# Altium schematic sheet analog_power.SchDoc: Analog power supply and filtration
size A4; DocumentNumber: ADC-SCH-04; SheetNumber: 4; SheetTotal: 20
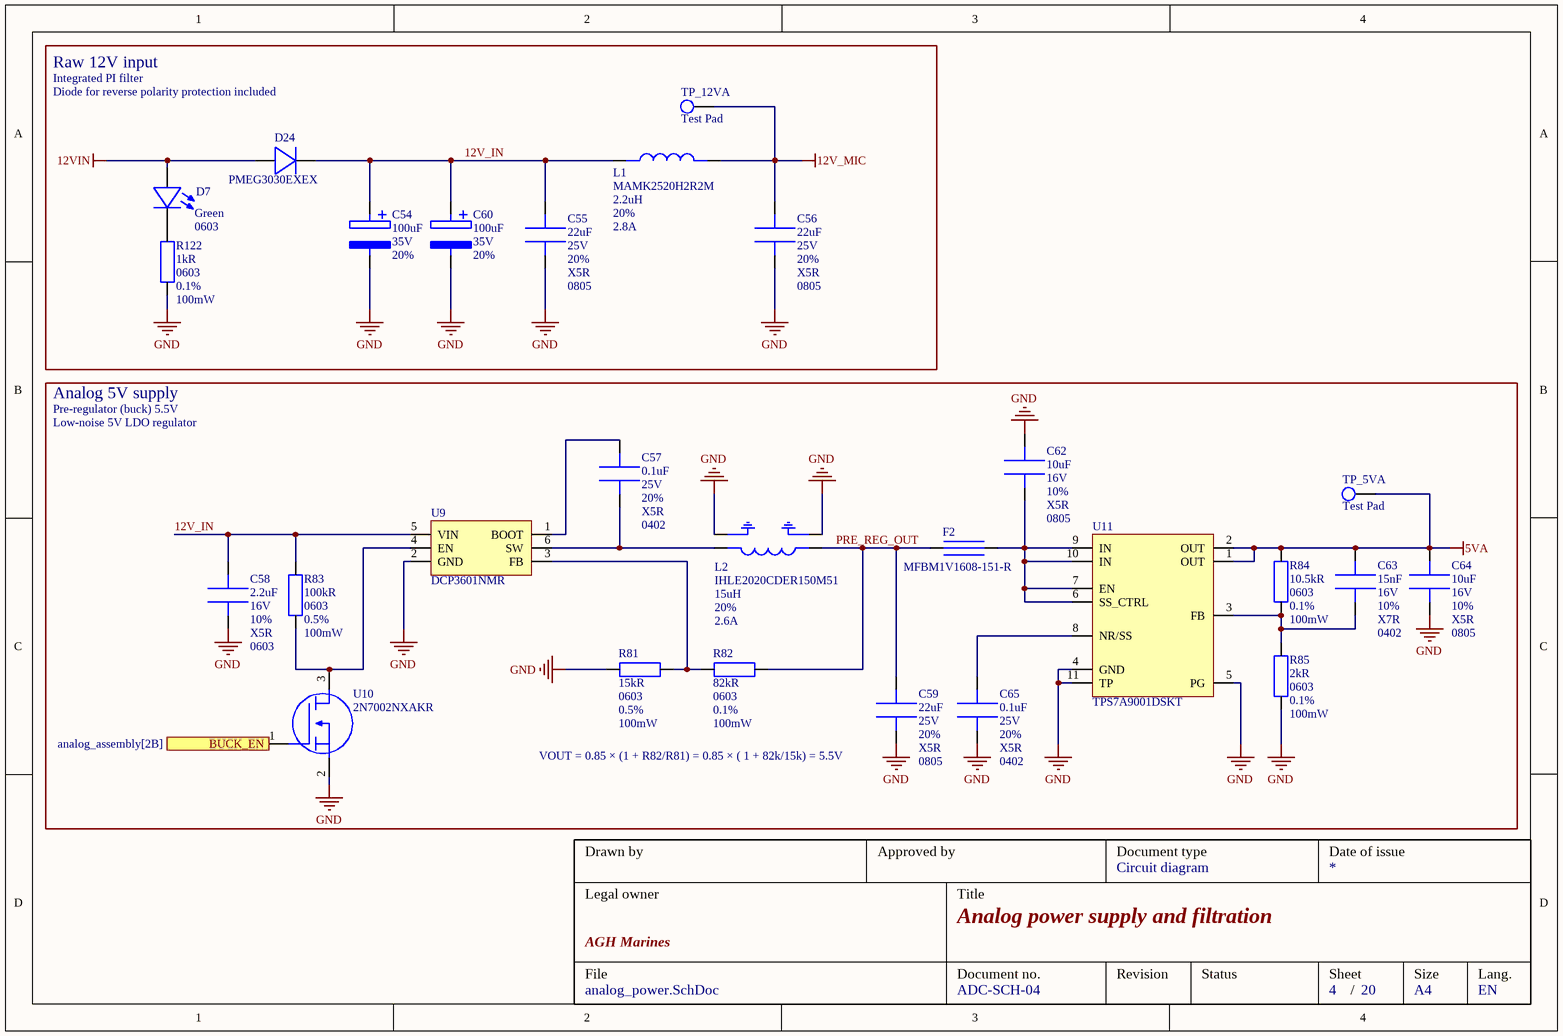
[diagram p0: analog_power.SchDoc]

## Parts
C54  value 100uF  Voltage: 35V  Tolerance: 20%  [CAPE_6.3R_7.7H]  (hidden comment: EDK107M035S9HAA)
C55  value 22uF  Voltage: 25V  Tolerance: 20%  Dielectric: X5R  Package: 0805  [CAPC_0805]  (hidden comment: CL21A226MAYNNNE)
C56  value 22uF  Voltage: 25V  Tolerance: 20%  Dielectric: X5R  Package: 0805  [CAPC_0805]  (hidden comment: CL21A226MAYNNNE)
C57  value 0.1uF  Voltage: 25V  Tolerance: 20%  Dielectric: X5R  Package: 0402  [CAPC_0402]  (hidden comment: MSAST105SB5104MFNA01)
C58  value 2.2uF  Voltage: 16V  Tolerance: 10%  Dielectric: X5R  Package: 0603  [CAPC_0603]  (hidden comment: C0603C225K4PAC)
C59  value 22uF  Voltage: 25V  Tolerance: 20%  Dielectric: X5R  Package: 0805  [CAPC_0805]  (hidden comment: CL21A226MAYNNNE)
C60  value 100uF  Voltage: 35V  Tolerance: 20%  [CAPE_6.3R_7.7H]  (hidden comment: EDK107M035S9HAA)
C62  value 10uF  Voltage: 16V  Tolerance: 10%  Dielectric: X5R  Package: 0805  [CAPC_0805]  (hidden comment: EMK212BJ106KG-T)
C63  value 15nF  Voltage: 16V  Tolerance: 10%  Dielectric: X7R  Package: 0402  [CAPC_0402]  (hidden comment: C0402C153K4RAC)
C64  value 10uF  Voltage: 16V  Tolerance: 10%  Dielectric: X5R  Package: 0805  [CAPC_0805]  (hidden comment: EMK212BJ106KG-T)
C65  value 0.1uF  Voltage: 25V  Tolerance: 20%  Dielectric: X5R  Package: 0402  [CAPC_0402]  (hidden comment: MSAST105SB5104MFNA01)
D7  package: 0603  color: Green  [DIOC_0603_LED]  (hidden comment: KG EELP41.22-PHRH-35-A8J8-20-R18)
D24  PMEG3030EXEX  [DIOC_SOD123HP-2]
F2  MFBM1V1608-151-R  [FERC_0603]
L1  MAMK2520H2R2M  Inductance: 2.2uH  Tolerance: 20%  Saturation Current: 2.8A  [IND_1008]
L2  IHLE2020CDER150M51  Saturation Current: 2.6A  Tolerance: 20%  Inductance: 15uH  [IND_2020_S]
R81  value 15kR  Package: 0603  Tolerance: 0.5%  Power: 100mW  [RESC_0603]  (hidden comment: RT0603DRD0715KL)
R82  value 82kR  Package: 0603  Tolerance: 0.1%  Power: 100mW  [RESC_0603]  (hidden comment: RT0603BRD0782KL)
R83  value 100kR  Package: 0603  Tolerance: 0.5%  Power: 100mW  [RESC_0603]  (hidden comment: AC0603DR-07100KL)
R84  value 10.5kR  Package: 0603  Tolerance: 0.1%  Power: 100mW  [RESC_0603]  (hidden comment: RT0603BRD0710K5L)
R85  value 2kR  Package: 0603  Tolerance: 0.1%  Power: 100mW  [RESC_0603]  (hidden comment: RT0603BRD072KL)
R122  value 1kR  Package: 0603  Tolerance: 0.1%  Power: 100mW  [RESC_0603]  (hidden comment: RP0603BRD071KL)
TP_5VA  Test Pad  [TP_1.4mm]
TP_12VA  Test Pad  [TP_1.4mm]
U9  DCP3601NMR  [IC_SOT23-6]
U10  2N7002NXAKR  [IC_SOT-23-3]
U11  TPS7A9001DSKT  [IC_SON-10]

## Blocks framed on the sheet
Raw 12V input: C54-C56 C60 D7 D24 L1 R122 TP_12VA
Analog 5V supply: C57-C59 C62-C65 F2 L2 R81-R85 TP_5VA U9-U11

## Ports
BUCK_EN (in, see analog_assembly[2B])

## Nets
5VA: C63.1 C64.1 R84.1 TP_5VA.1 U11.1(OUT) U11.2(OUT)
12V_MIC: C56.1 L1.2 TP_12VA.1
12VIN: D7.1 D24.1
GND: C54.2 C55.2 C56.2 C58.2 C59.2 C60.2 C62.1 C64.2 C65.2 L2.3 L2.4 R81.2 R85.2 R122.2 U9.2(GND) U10.2(S) U11.4(GND) U11.5(PG) U11.11(TP)
12V_IN: C54.1 C55.1 C58.1 C60.1 D24.2 L1.1 R83.1 U9.5(VIN)
BUCK_EN: U10.1(G) ; port BUCK_EN
PRE_REG_OUT: C59.1 F2.2 L2.1 R82.1
NetC57_1: C57.1 U9.1(BOOT)
NetC57_2: C57.2 L2.2 U9.6(SW)
NetC62_2: C62.2 F2.1 U11.6(SS_CTRL) U11.7(EN) U11.9(IN) U11.10(IN)
NetC63_2: C63.2 R84.2 R85.1 U11.3(FB)
NetC65_1: C65.1 U11.8(NR/SS)
NetD7_2: D7.2 R122.1
NetR81_1: R81.1 R82.2 U9.3(FB)
NetR83_2: R83.2 U9.4(EN) U10.3(D)

## Notes on the sheet
- Integrated PI filter
- Diode for reverse polarity protection included
- Pre-regulator (buck) 5.5V
- Low-noise 5V LDO regulator
- (near C59) VOUT = 0.85 × (1 + R82/R81) = 0.85 × ( 1 + 82k/15k) = 5.5V
- Drawn by
- Approved by
- Document type
- Date of issue
- Legal owner
- Title
- Circuit diagram
- File
- AGH Marines
- Document no.
- Revision
- Status
- Sheet
- Size
- Lang.
- /
- A4
- EN

## Library data of the parts
C54 C60 = EDK107M035S9HAA: Aluminum Electrolytic Capacitors - SMD 35V 100uF AEC-Q200 20% 85C/2K Hours; Manufacturer: KEMET; Package: 6.3x7.7; Supplier 1: Mouser; Supplier Part Number 1: 80-EDK107M035S9HAA
C55 C56 C59 = CL21A226MAYNNNE: Multilayer Ceramic Capacitors MLCC - SMD/SMT 22uF+/-20% 25V X5R 2 0805; Manufacturer: TAIYO YUDEN; Supplier 1: Mouser; Supplier Part Number 1: 187-CL21A226MAYNNNE
C57 C65 = MSAST105SB5104MFNA01: Multilayer Ceramic Capacitors MLCC - SMD/SMT 25V 0.1uF X5R 0402 20%; Manufacturer: TAIYO YUDEN; Supplier 1: Mouser; Supplier Part Number 1: 963-MSAST105SB5104MF
C58 = C0603C225K4PAC: Multilayer Ceramic Capacitors MLCC - SMD/SMT 16V 2.2uF X5R 0603 10%; Manufacturer: KEMET; Supplier 1: Mouser; Supplier Part Number 1: 80-C0603C225K4PAC
C62 C64 = EMK212BJ106KG-T: Multilayer Ceramic Capacitors MLCC - SMD/SMT 16V 10uF X5R 0805 10 %; Manufacturer: TAIYO YUDEN; Supplier 1: Mouser; Supplier Part Number 1: 963-EMK212BJ106KG-T
C63 = C0402C153K4RAC: Multilayer Ceramic Capacitors MLCC - SMD/SMT 16V 0.015uF X7R 0402 10%; Manufacturer: KEMET; Supplier 1: Mouser; Supplier Part Number 1: 80-C0402C153K4RAC
D7 = KG EELP41.22-PHRH-35-A8J8-20-R18: Single Color LEDs; Supplier 1: Mouser; Supplier Part Number 1: 720-P4122PHRH35A8J82
D24 = PMEG3030EXEX: Schottky Diodes & Rectifiers RECT 30V 3A SM SCHOTTKY; Manufacturer: Nexperia; Forward Voltage: 500mV; Package: SOD123HP-2; Current: 3A; Supplier 1: Mouser; Supplier Part Number 1: 771-PMEG3030EXEX
F2 = BBPY00160808471Y00: Ferrite Beads 470Ohms RDC=0.15Ohms 1500mA; Manufacturer: Pulse Electronics; Package: 0603; Supplier 1: Mouser; Supplier Part Number 1: 603-BBPY160808471Y00
L1 = MAMK2520H2R2M: Power Inductors - SMD 963-LSAPB2520MKT2R2M RPLCMT PN 1008 2.2uH 90mOhmsur; Manufacturer: TAIYO YUDEN; Package: 1008; Supplier 1: Mouser; Supplier Part Number 1: 963-MAMK2520H2R2M
L2 = IHLE2020CDER150M51: Power Inductors - SMD 15uH 20% w/E-Field; Manufacturer: Vishay; Package: 2020; Supplier 1: Mouser; Supplier Part Number 1: 70-IHLE2020CDR150M51
R81 = RT0603DRD0715KL: Thin Film Resistors 15K Ohm 0.5% 1/10W 75 Volts 25ppm; Manufacturer: YAGEO; Supplier 1: Mouser; Supplier Part Number 1: 603-RT0603DRD0715KL
R82 = RT0603BRD0782KL: Thin Film Resistors 1/10W 82K ohm .1% 25ppm; Manufacturer: YAGEO; Supplier 1: Mouser; Supplier Part Number 1: 603-RT0603BRD0782KL
R83 = AC0603DR-07100KL: Thick Film Resistors - SMD 100 kOhms 1/10 W 75 V 0.5 % 0603 100 PPM / C - 55 C / + 155 C AEC-Q200; Manufacturer: YAGEO; Supplier 1: Mouser; Supplier Part Number 1: 603-AC0603DR-07100KL
R84 = RT0603BRD0710K5L: Thin Film Resistors 1/10W 10.5K ohm .1% 25ppm; Manufacturer: YAGEO; Supplier 1: Mouser; Supplier Part Number 1: 603-RT0603BRD0710K5L
R85 = RT0603BRD072KL: Thin Film Resistors 2K OHM .1% 25PPM; Manufacturer: YAGEO; Supplier 1: Mouser; Supplier Part Number 1: 603-RT0603BRD072KL
R122 = RP0603BRD071KL: Thin Film Resistors 1/10 Wat 1K Ohm 0.1% 0603 AEC-Q200; Manufacturer: YAGEO; Supplier 1: Mouser; Supplier Part Number 1: 603-RP0603BRD071KL
U9 = DCP3601NMR: Switching Voltage Regulators 36 V, 1 A synchronous step-down converter in SOT23-6L; Manufacturer: STMicroelectronics; Package: SOT23-6; Supplier 1: Mouser; Supplier Part Number 1: 511-DCP3601NMR
U10 = 2N7002NXAKR: MOSFETs SOT23 N-CH 60V .3A; Manufacturer: Nexperia; Package: SOT23-3; Supplier 1: Mouser; Supplier Part Number 1: 771-2N7002NXAKR
U11 = TPS7A9001DSKT: LDO Voltage Regulators 500-mA low-noise h igh-PSRR adjustable A 595-TPS7A9001DSKR; Manufacturer: Texas Instruments; Package: SON-10; Supplier 1: Mouser; Supplier Part Number 1: 595-TPS7A9001DSKT